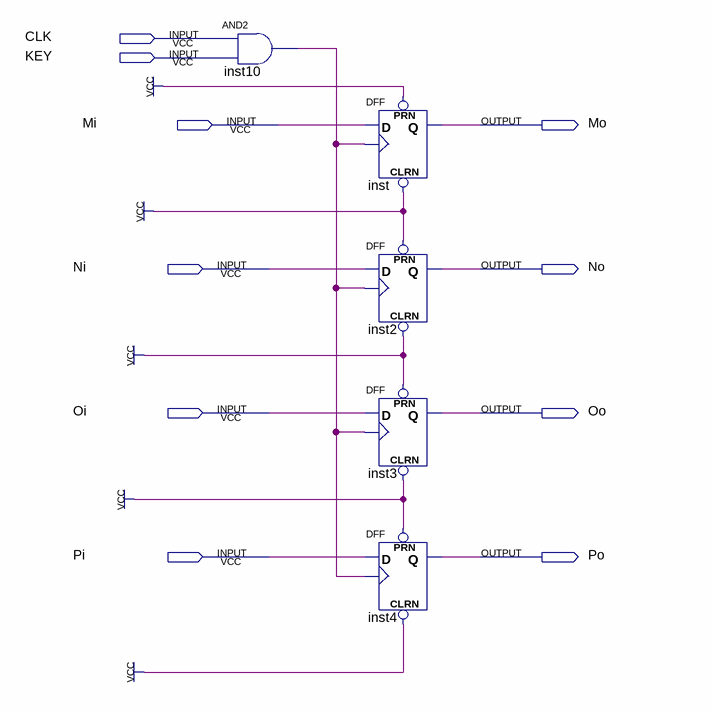
[diagram p0: schematic sheet]
// Quartus schematic carregador.bdf as structural Verilog: 5 symbols, 10 pins
module carregador (
  input  CLK,
  input  KEY,
  input  Mi,
  input  Ni,
  input  Oi,
  input  Pi,
  output Mo,
  output No,
  output Oo,
  output Po
);

  wire inst10_out;

  and inst10 (inst10_out, CLK, KEY);
  DFF inst (.CLRN(1'b1), .CLK(inst10_out), .D(Mi), .PRN(1'b1), .Q(Mo));
  DFF inst2 (.CLRN(1'b1), .CLK(inst10_out), .D(Ni), .PRN(1'b1), .Q(No));
  DFF inst3 (.CLRN(1'b1), .CLK(inst10_out), .D(Oi), .PRN(1'b1), .Q(Oo));
  DFF inst4 (.CLRN(1'b1), .CLK(inst10_out), .D(Pi), .PRN(1'b1), .Q(Po));
endmodule
